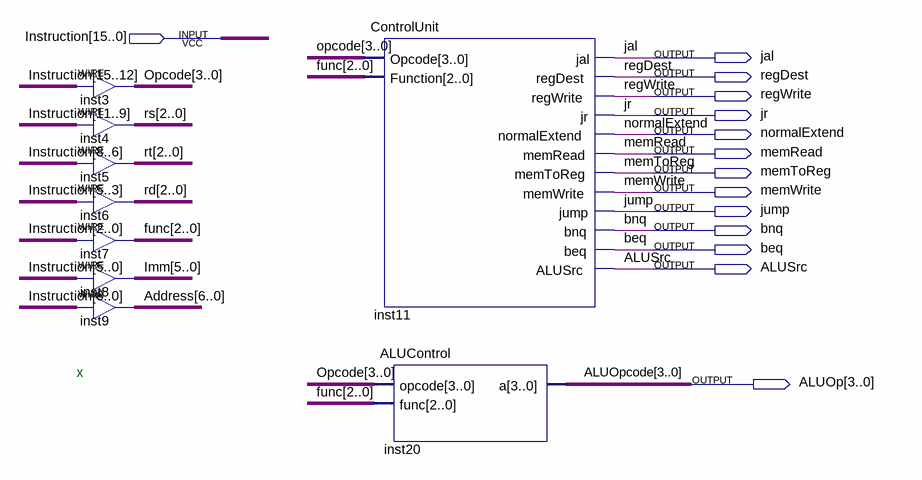
[diagram p0: schematic sheet]
// Quartus schematic ControlSignals.bdf as structural Verilog: 9 symbols, 14 pins
module ControlSignals (
  input  [15:0] Instruction,
  output jal,
  output regDest,
  output regWrite,
  output jr,
  output normalExtend,
  output memRead,
  output memToReg,
  output memWrite,
  output jump,
  output bnq,
  output beq,
  output ALUSrc,
  output [3:0] ALUOp
);

  wire [2:0] func, rd, rs, rt;
  wire [3:0] opcode;
  wire [5:0] Imm;
  wire [6:0] Address;

  assign opcode = Instruction[15:12];  // WIRE inst3
  assign rs = Instruction[11:9];  // WIRE inst4
  assign rt = Instruction[8:6];  // WIRE inst5
  assign rd = Instruction[5:3];  // WIRE inst6
  assign func = Instruction[2:0];  // WIRE inst7
  assign Imm = Instruction[5:0];  // WIRE inst8
  assign Address = Instruction[6:0];  // WIRE inst9
  ControlUnit inst11 (
    .Opcode(opcode), .Function(func), .jal(jal), .regDest(regDest), .regWrite(regWrite), .jr(jr),
    .normalExtend(normalExtend), .memRead(memRead), .memToReg(memToReg), .memWrite(memWrite), .jump(jump),
    .bnq(bnq), .beq(beq), .ALUSrc(ALUSrc));
  ALUControl inst20 (.opcode(opcode), .func(func), .a(ALUOp));

  // Other names for the same wires on the sheet: ALUOpcode[3:0] = ALUOp

  // Notes on the sheet:
  //   x
endmodule
